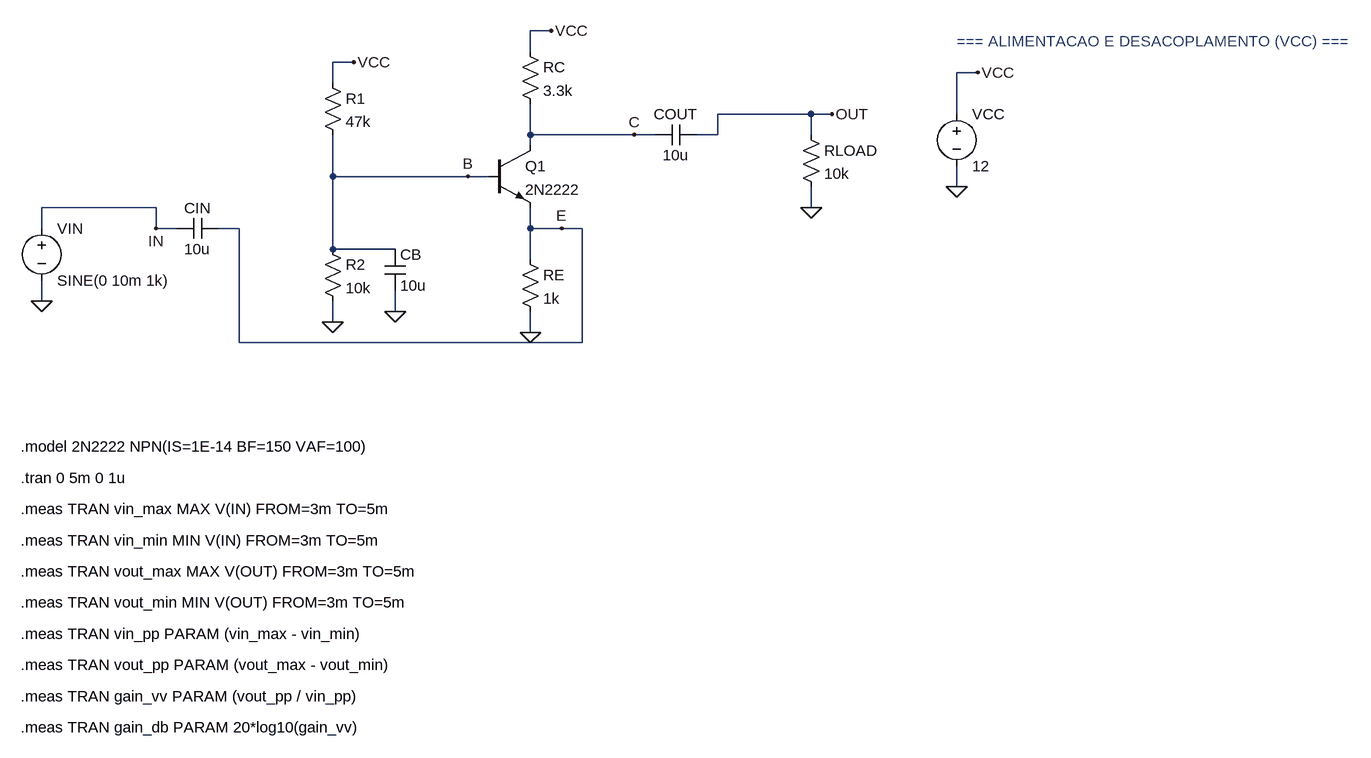
[diagram p0: schematic 03_common_base.asc]
03_common_base.asc, the LTspice schematic file:
Version 4
SHEET 1 2592 1280
WIRE 96 448 96 480
WIRE 304 368 272 368
WIRE 368 368 400 368
WIRE 544 144 544 112
WIRE 544 112 576 112
WIRE 544 224 544 400
WIRE 544 288 576 288
WIRE 544 480 544 512
WIRE 544 400 640 400
WIRE 640 464 640 496
WIRE 784 288 752 288
WIRE 848 96 848 64
WIRE 848 64 880 64
WIRE 848 176 848 240
WIRE 848 224 896 224
WIRE 848 336 848 416
WIRE 848 368 896 368
WIRE 848 496 848 528
WIRE 1040 224 1008 224
WIRE 1104 224 1136 224
WIRE 1280 224 1280 192
WIRE 1280 192 1312 192
WIRE 1280 304 1280 336
WIRE 1504 192 1504 128
WIRE 1504 272 1504 304
WIRE 1504 128 1536 128
WIRE 96 368 96 336
WIRE 96 336 128 336
WIRE 896 224 1008 224
WIRE 128 336 272 336
WIRE 272 336 272 368
WIRE 576 288 752 288
WIRE 1136 224 1136 192
WIRE 1136 192 1312 192
WIRE 400 368 400 544
WIRE 400 544 928 544
WIRE 928 544 928 368
WIRE 928 368 896 368
FLAG 96 480 0
FLAG 272 368 IN
FLAG 576 112 VCC
FLAG 544 512 0
FLAG 640 496 0
FLAG 752 288 B
FLAG 880 64 VCC
FLAG 896 368 E
FLAG 848 528 0
FLAG 1008 224 C
FLAG 1312 192 OUT
FLAG 1280 336 0
FLAG 1504 304 0
FLAG 1536 128 VCC
SYMBOL voltage 96 352 R0
WINDOW 3 24 96 Left 2
SYMATTR InstName VIN
SYMATTR Value SINE(0 10m 1k)
SYMBOL cap 368 352 R90
WINDOW 0 0 32 VBottom 2
WINDOW 3 32 32 VTop 2
SYMATTR InstName CIN
SYMATTR Value 10u
SYMBOL res 528 128 R0
SYMATTR InstName R1
SYMATTR Value 47k
SYMBOL res 528 384 R0
SYMATTR InstName R2
SYMATTR Value 10k
SYMBOL cap 624 400 R0
SYMATTR InstName CB
SYMATTR Value 10u
SYMBOL npn 784 240 R0
SYMATTR InstName Q1
SYMATTR Value 2N2222
SYMBOL res 832 80 R0
SYMATTR InstName RC
SYMATTR Value 3.3k
SYMBOL res 832 400 R0
SYMATTR InstName RE
SYMATTR Value 1k
SYMBOL cap 1104 208 R90
WINDOW 0 0 32 VBottom 2
WINDOW 3 32 32 VTop 2
SYMATTR InstName COUT
SYMATTR Value 10u
SYMBOL res 1264 208 R0
SYMATTR InstName RLOAD
SYMATTR Value 10k
SYMBOL voltage 1504 176 R0
WINDOW 3 24 96 Left 2
SYMATTR InstName VCC
SYMATTR Value 12
TEXT 1504 80 Left 2 ;=== ALIMENTACAO E DESACOPLAMENTO (VCC) ===
TEXT 64 704 Left 2 !.model 2N2222 NPN(IS=1E-14 BF=150 VAF=100)
TEXT 64 752 Left 2 !.tran 0 5m 0 1u
TEXT 64 800 Left 2 !.meas TRAN vin_max MAX V(IN) FROM=3m TO=5m
TEXT 64 848 Left 2 !.meas TRAN vin_min MIN V(IN) FROM=3m TO=5m
TEXT 64 896 Left 2 !.meas TRAN vout_max MAX V(OUT) FROM=3m TO=5m
TEXT 64 944 Left 2 !.meas TRAN vout_min MIN V(OUT) FROM=3m TO=5m
TEXT 64 992 Left 2 !.meas TRAN vin_pp PARAM (vin_max - vin_min)
TEXT 64 1040 Left 2 !.meas TRAN vout_pp PARAM (vout_max - vout_min)
TEXT 64 1088 Left 2 !.meas TRAN gain_vv PARAM (vout_pp / vin_pp)
TEXT 64 1136 Left 2 !.meas TRAN gain_db PARAM 20*log10(gain_vv)

The netlist it stands for:
* 03_common_base.asc
VIN IN 0 SINE(0 10m 1k)
CIN E IN 10u
R1 VCC B 47k
R2 B 0 10k
CB B 0 10u
Q1 C B E 0 2N2222
RC VCC C 3.3k
RE E 0 1k
COUT OUT C 10u
RLOAD OUT 0 10k
VCC VCC 0 12
.model NPN NPN
.model PNP PNP
.lib standard.bjt
* === ALIMENTACAO E DESACOPLAMENTO (VCC) ===
.model 2N2222 NPN(IS=1E-14 BF=150 VAF=100)
.tran 0 5m 0 1u
.meas TRAN vin_max MAX V(IN) FROM=3m TO=5m
.meas TRAN vin_min MIN V(IN) FROM=3m TO=5m
.meas TRAN vout_max MAX V(OUT) FROM=3m TO=5m
.meas TRAN vout_min MIN V(OUT) FROM=3m TO=5m
.meas TRAN vin_pp PARAM (vin_max - vin_min)
.meas TRAN vout_pp PARAM (vout_max - vout_min)
.meas TRAN gain_vv PARAM (vout_pp / vin_pp)
.meas TRAN gain_db PARAM 20*log10(gain_vv)
.backanno
.end